# Altium schematic sheet Zasilanie.SchDoc (part 3 of 3)
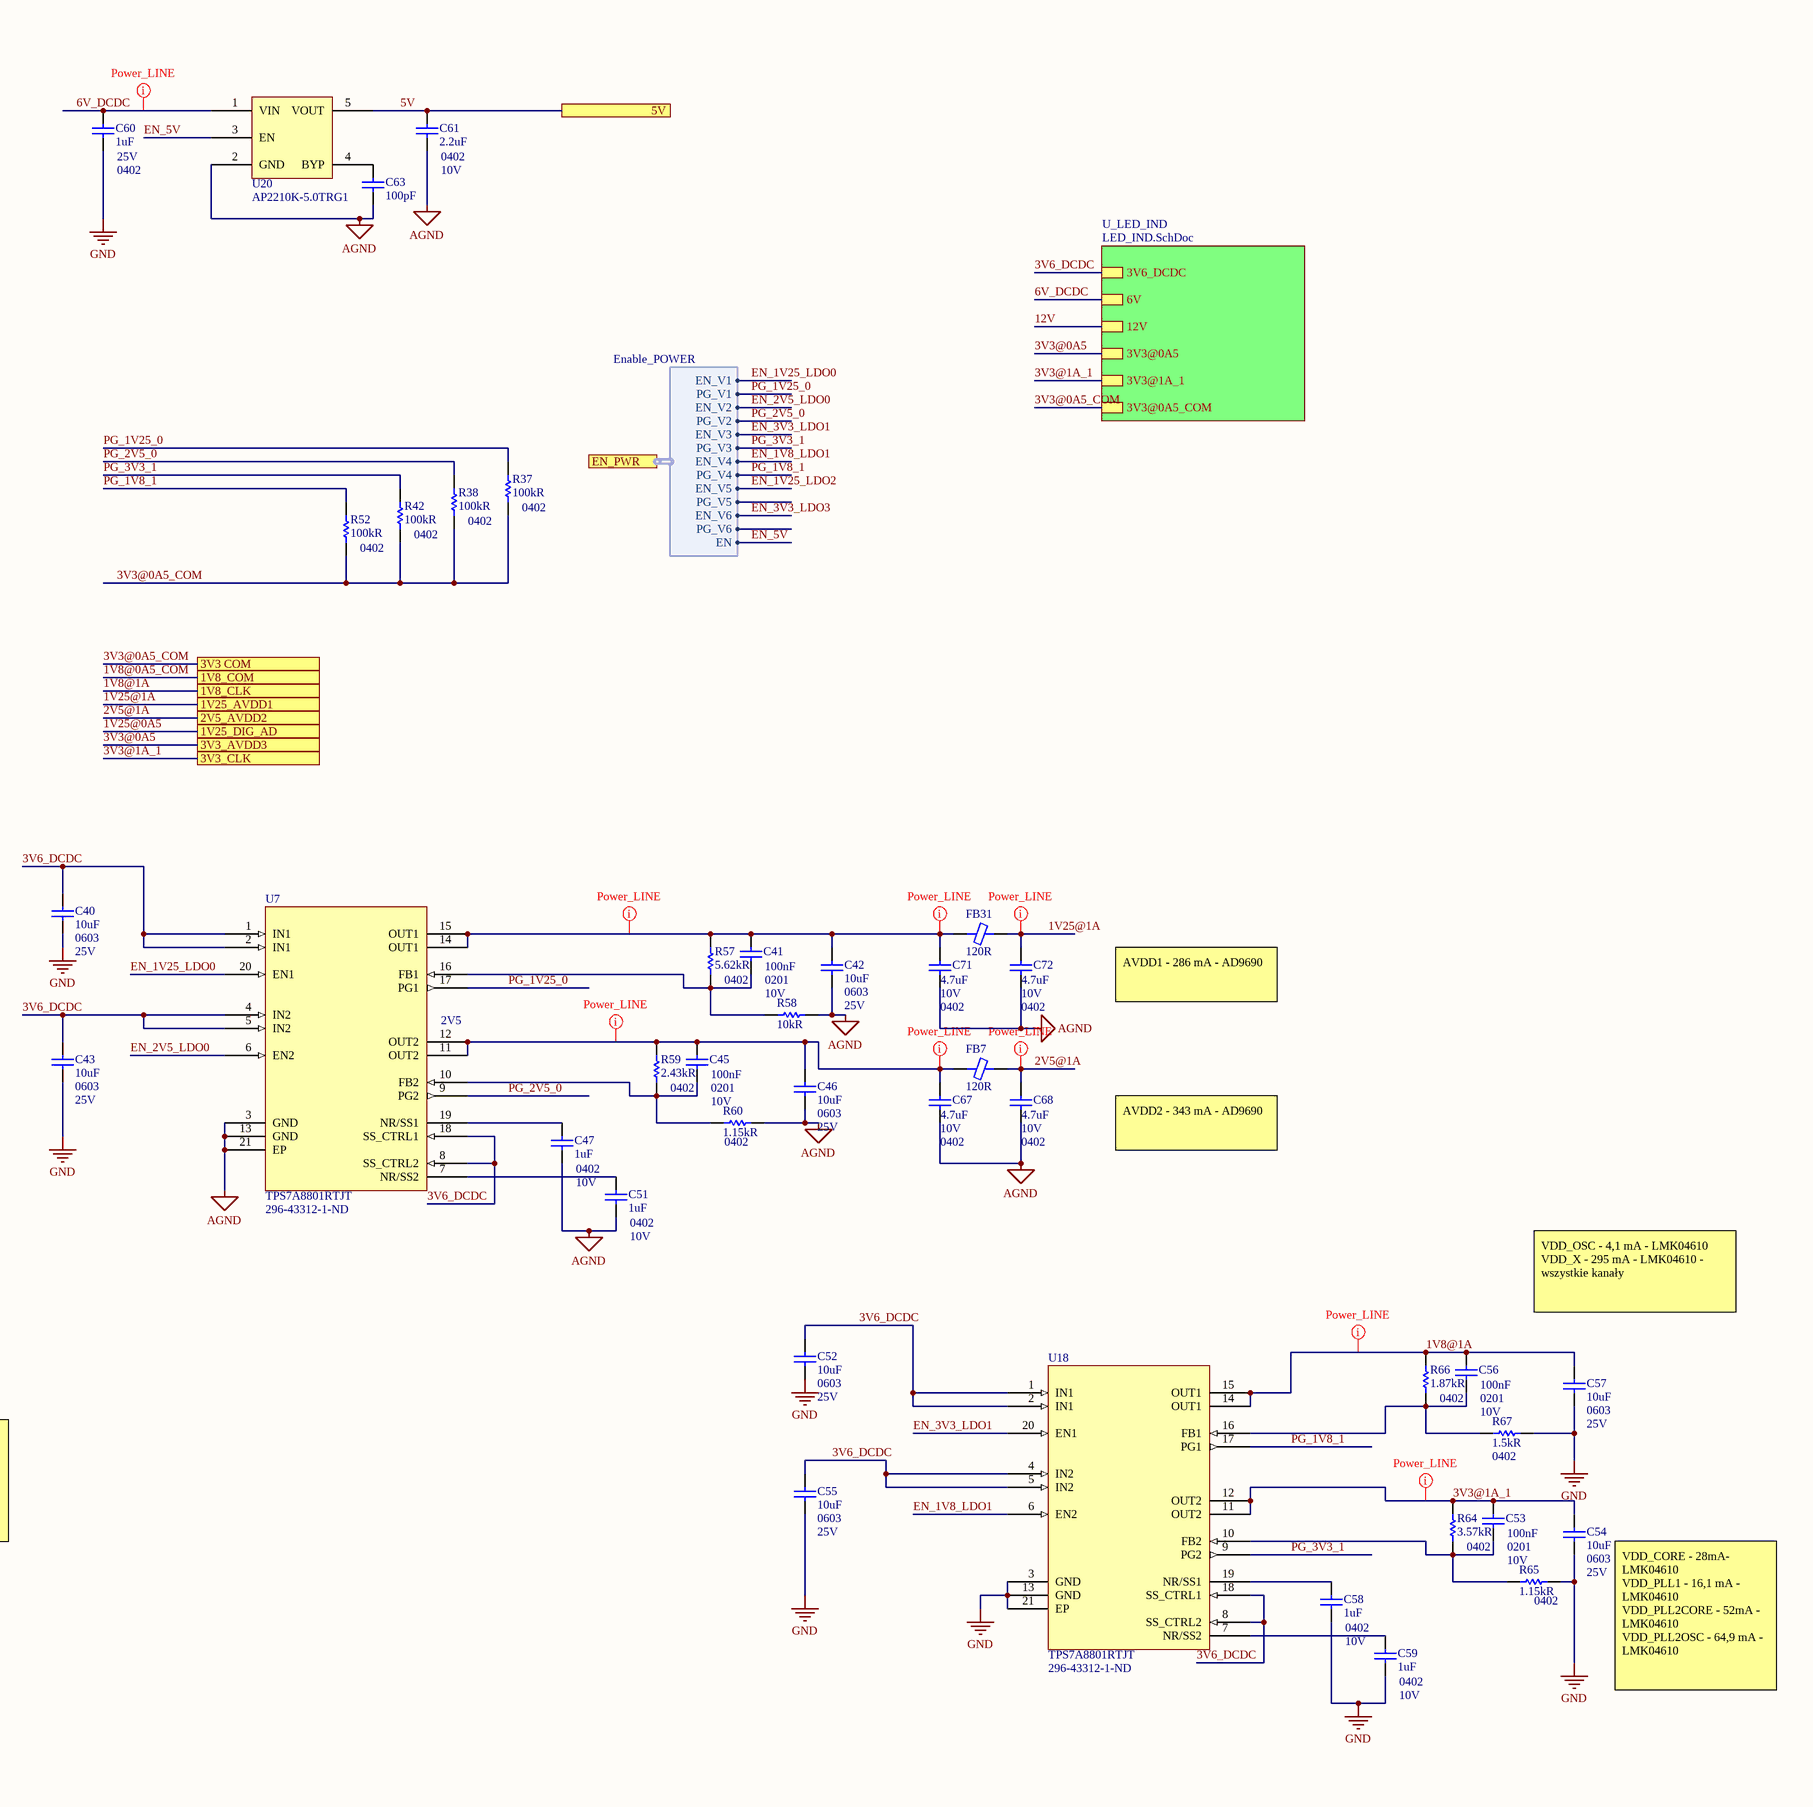
[diagram p3: Zasilanie.SchDoc, right]

## Library data of the parts (continued)
R68 R127 = Resistor: Res Thick Film 0402 14.7K Ohm 1% 0.063W(1/16W) ±100ppm/C Epoxy SMD T/R; Manufacturer: Yageo; Manufacturer Part Number: RC0402FR-0714K7L; Power Rating: 62.5mW; Voltage Rating: 50V; Temperature Coefficient: 100ppm/°C; Max Power Dissipation: 63mW; Supplier 1: Digi-Key; Supplier Part Number 1: YAG2984CT-ND; RoHS: Yes; Category: Chip SMD Resistors; Stock 1: 135925; Pricing 1: 1=0,10000, 10=0,01600, 100=0,00640, 1000=0,00289, 2500=0,00251, 5000=0,00207 (USD); Case Code (Imperial): 0402; Case Code (Metric): 1005; Contact Plating: Tin,Matte; Min Operating Temperature: -55°C; Max Operating Temperature: 155°C; Tolerance: 1%; Resistance: 14.7kR; Packaging: Tape and Reel; Composition: Thick Film; Number of Terminations: 2; Termination: SMD/SMT; Military Standard: Not; Features: Moisture Resistant; Length: 1mm; Height: 0.016inch; Width: 0.02inch; Depth: 0.5mm; Radiation Hardening: No; Lead Free: Lead Free; ComponentLink1URL: https://datasheet.ciiva.com/12668/pyu-rc0402-51-rohs-l-6-r-12668214.pdf?src-supplier=Mouser; ComponentLink1Description: https://datasheet.ciiva.com/12668/pyu-rc0402-51-rohs-l-6-r-12668214.pdf?src-supplier=Mouser; ComponentLink2URL: https://datasheet.ciiva.com/28404/pyu-rc0402-51-rohs-l-6-28404249.pdf?src-supplier=Avnet+Europe; ComponentLink2Description: https://datasheet.ciiva.com/28404/pyu-rc0402-51-rohs-l-6-28404249.pdf?src-supplier=Avnet+Europe; ComponentLink3URL: https://datasheet.ciiva.com/8890/pyu-rc0402-51-rohs-l-6-8890796.pdf?src-supplier=Avnet; ComponentLink3Description: https://datasheet.ciiva.com/8890/pyu-rc0402-51-rohs-l-6-8890796.pdf?src-supplier=Avnet; ComponentLink4URL: https://datasheet.ciiva.com/16869/pyu-rc0402-51-rohs-l-6-16869068.pdf?src-supplier=Avnet+Europe; ComponentLink4Description: https://datasheet.ciiva.com/16869/pyu-rc0402-51-rohs-l-6-16869068.pdf?src-supplier=Avnet+Europe; ComponentLink5URL: https://datasheet.ciiva.com/26829/getdatasheetpartid-326415-26829900.pdf?src-supplier=Verical; ComponentLink5Description: https://datasheet.ciiva.com/26829/getdatasheetpartid-326415-26829900.pdf?src-supplier=Verical
R118 = Resistor: RES SMD 51.1KOHM 0.1% 1/16W 0402; Manufacturer: Yageo; Manufacturer Part Number: RT0402BRD0751K1L; Voltage Rating: 50V; Power Rating: 62.5mW; Temperature Coefficient: 25ppm/°C; Max Power Dissipation: 63mW; Supplier 1: Digi-Key; Supplier Part Number 1: 13-RT0402BRD0751K1LCT-ND; RoHS: Yes; Category: Chip SMD Resistors; Stock 1: 9318; Pricing 1: 1=0,38000, 10=0,32000, 100=0,12500, 1000=0,05234, 2500=0,04798, 5000=0,04362 (USD); Case Code (Metric): 1005; Case Code (Imperial): 0402; Min Operating Temperature: -55°C; Max Operating Temperature: 125°C; Resistance: 51.1kR; Tolerance: 0.1%; Packaging: Tape and Reel; Package Quantity: 10000; Resistor Type: Thin Film; Termination: SMD/SMT; Number of Terminations: 2; Voltage Rating (DC): 50V; Length: 0.039inch; Width: 0.02inch; Height: 0.014inch; Lead Free: Lead Free; ComponentLink1URL: https://datasheet.ciiva.com/12724/pyu-rt-1-to-0-05-rohs-l-4-12724108.pdf?src-supplier=Mouser; ComponentLink1Description: https://datasheet.ciiva.com/12724/pyu-rt-1-to-0-05-rohs-l-4-12724108.pdf?src-supplier=Mouser; ComponentLink2URL: https://datasheet.ciiva.com/2582/pyu-rt-1-to-0-05-rohs-l-5-2582414.pdf?src-supplier=Digi-Key; ComponentLink2Description: https://datasheet.ciiva.com/2582/pyu-rt-1-to-0-05-rohs-l-5-2582414.pdf?src-supplier=Digi-Key
R121 R125 = Resistor: RES SMD 14.7KOHM 0.1% 1/16W 0402; Manufacturer: Yageo; Manufacturer Part Number: RT0402BRD0714K7L; Power Rating: 62.5mW; Voltage Rating: 50V; Temperature Coefficient: 25ppm/°C; Supplier 1: Digi-Key; Supplier Part Number 1: YAG4174CT-ND; RoHS: Yes; Category: Chip SMD Resistors; Stock 1: 23357; Pricing 1: 1=0,38000, 10=0,32000, 100=0,12500, 1000=0,05234, 2500=0,04798, 5000=0,04362 (USD); Case Code (Imperial): 0402; Case Code (Metric): 1005; Weight: 2.3E-05oz; Min Operating Temperature: -55°C; Max Operating Temperature: 125°C; Resistance: 14.7kR; Packaging: Tape and Reel; Tolerance: 0.1%; Resistor Type: Thin Film; Termination: SMD/SMT; Voltage Rating (DC): 50V; Length: 1mm; Width: 0.5mm; Height: 0.3mm; Depth: 0.5mm; Military Standard: Not; Lead Free: Lead Free; ComponentLink1URL: http://www.mouser.com/ds/2/447/yageodocoutput-1125656.pdf?src-supplier=Mouser; ComponentLink1Description: http://www.mouser.com/ds/2/447/yageodocoutput-1125656.pdf?src-supplier=Mouser; ComponentLink2URL: http://components.arrow.com/part/dataview/0323_03313223?src-supplier=Arrow+Europe; ComponentLink2Description: http://components.arrow.com/part/dataview/0323_03313223?src-supplier=Arrow+Europe; ComponentLink3URL: http://www.yageo.com/documents/recent/PYu-RT_1-to-0.01_RoHS_L_9.pdf?src-supplier=Digi-Key; ComponentLink3Description: http://www.yageo.com/documents/recent/PYu-RT_1-to-0.01_RoHS_L_9.pdf?src-supplier=Digi-Key
R122 = Resistor: RES SMD 95.3K OHM 0.1% 1/16W; Manufacturer: Yageo; Manufacturer Part Number: RT0402BRD0795K3L; Power Rating: 62.5mW; Voltage Rating: 50V; Max Power Dissipation: 63mW; Temperature Coefficient: 25ppm/°C; Supplier 1: Digi-Key; Supplier Part Number 1: YAG4322CT-ND; RoHS: Yes; Category: Chip SMD Resistors; Stock 1: 1587; Pricing 1: 1=0,38000, 10=0,32000, 100=0,12500, 1000=0,05234, 2500=0,04798, 5000=0,04362 (USD); Case Code (Metric): 1005; Case Code (Imperial): 0402; Min Operating Temperature: -55°C; Max Operating Temperature: 125°C; Package Quantity: 10000; Packaging: Tape and Reel; Resistance: 95.3kR; Tolerance: 0.1%; Resistor Type: Thin Film; Number of Terminations: 2; Termination: SMD/SMT; Voltage Rating (DC): 50V; Length: 0.039inch; Width: 0.02inch; Height: 0.014inch; Lead Free: Lead Free; ComponentLink1URL: https://datasheet.ciiva.com/2582/pyu-rt-1-to-0-05-rohs-l-5-2582534.pdf?src-supplier=Digi-Key; ComponentLink1Description: https://datasheet.ciiva.com/2582/pyu-rt-1-to-0-05-rohs-l-5-2582534.pdf?src-supplier=Digi-Key; ComponentLink2URL: https://datasheet.ciiva.com/12724/pyu-rt-1-to-0-05-rohs-l-4-12724119.pdf?src-supplier=Mouser; ComponentLink2Description: https://datasheet.ciiva.com/12724/pyu-rt-1-to-0-05-rohs-l-4-12724119.pdf?src-supplier=Mouser
R128 = Resistor: RES SMD 127K OHM 1% 1/16W 0402; Manufacturer: Yageo; Manufacturer Part Number: RC0402FR-07127KL; Power Rating: 62.5mW; Voltage Rating: 50V; Temperature Coefficient: 100ppm/°C; Max Power Dissipation: 63mW; Supplier 1: Digi-Key; Supplier Part Number 1: 311-127KLRCT-ND; RoHS: Yes; Category: Chip SMD Resistors; Stock 1: 164865; Pricing 1: 1=0,10000, 10=0,01400, 100=0,00580, 1000=0,00260, 2500=0,00226, 5000=0,00186 (USD); Case Code (Imperial): 0402; Case Code (Metric): 1005; Contact Plating: Tin,Matte; Min Operating Temperature: -55°C; Max Operating Temperature: 155°C; Resistance: 127kR; Tolerance: 1%; Packaging: Tape and Reel; Termination: SMD/SMT; Resistor Type: Thick Film; Number of Terminations: 2; Voltage Rating (DC): 50V; Package Quantity: 1; Features: Moisture Resistant; Length: 1mm; Width: 0.5mm; Height: 0.016inch; Depth: 0.5mm; Military Standard: Not; Lead Free: Lead Free; ComponentLink1URL: https://datasheet.ciiva.com/2453/pyu-r-int-thick-7-2453595.pdf?src-supplier=Digi-Key; ComponentLink1Description: https://datasheet.ciiva.com/2453/pyu-r-int-thick-7-2453595.pdf?src-supplier=Digi-Key; ComponentLink2URL: https://datasheet.ciiva.com/2453/pyu-r-int-thick-7-2453596.pdf?src-supplier=Digi-Key; ComponentLink2Description: https://datasheet.ciiva.com/2453/pyu-r-int-thick-7-2453596.pdf?src-supplier=Digi-Key; ComponentLink3URL: https://datasheet.ciiva.com/2453/pyu-r-int-thick-7-2453597.pdf?src-supplier=Digi-Key; ComponentLink3Description: https://datasheet.ciiva.com/2453/pyu-r-int-thick-7-2453597.pdf?src-supplier=Digi-Key; ComponentLink4URL: https://datasheet.ciiva.com/16869/pyu-rc0402-51-rohs-l-6-16869774.pdf?src-supplier=Avnet+Europe; ComponentLink4Description: https://datasheet.ciiva.com/16869/pyu-rc0402-51-rohs-l-6-16869774.pdf?src-supplier=Avnet+Europe
R131 = Resistor: Res Thick Film 0402 48.7K Ohm 1% 1/16W 100ppm/C Molded SMD Paper T/R; Manufacturer: Stackpole Electronics; Manufacturer Part Number: RMCF0402FT48K7; Max Power Dissipation: 63mW; Temperature Coefficient: 100ppm/°C; Supplier 1: Digi-Key; Supplier Part Number 1: RMCF0402FT48K7CT-ND; RoHS: Yes; Category: Chip SMD Resistors; Stock 1: 91344; Pricing 1: 1=0,10000, 10=0,01300, 100=0,00530, 1000=0,00239, 2500=0,00207, 5000=0,00171 (USD); Mount: Surface Mount; Case Code (Metric): 1005; Contact Plating: Tin,Matte; Case Code (Imperial): 0402; Min Operating Temperature: -55°C; Max Operating Temperature: 155°C; Features: Automotive AEC-Q200; Resistance: 48.7kR; Tolerance: 1%; Packaging: Tape and Reel; Resistor Type: Thick Film; Number of Terminations: 2; Length: 0.039inch; Width: 0.02inch; Height: 0.016inch; Lead Free: Lead Free; ComponentLink1URL: http://components.arrow.com/part/dataview/50597970S14177N1174?src-supplier=Arrow+Electronics; ComponentLink1Description: http://components.arrow.com/part/dataview/50597970S14177N1174?src-supplier=Arrow+Electronics; ComponentLink2URL: https://www.seielect.com/Catalog/SEI-RMCF_RMCP.pdf?src-supplier=Digi-Key; ComponentLink2Description: https://www.seielect.com/Catalog/SEI-RMCF_RMCP.pdf?src-supplier=Digi-Key; ComponentLink3URL: https://www.seielect.com/Catalog/SEI-RMCF_RMCP.pdf?src-supplier=Avnet; ComponentLink3Description: https://www.seielect.com/Catalog/SEI-RMCF_RMCP.pdf?src-supplier=Avnet; ComponentLink4URL: https://www.seielect.com/catalog/SEI-Packaging.pdf?src-supplier=Digi-Key; ComponentLink4Description: https://www.seielect.com/catalog/SEI-Packaging.pdf?src-supplier=Digi-Key
U7 U18 = TPS7A8801RTJT: IC REG LINEAR POS ADJ 1A 20QFN; Manufacturer: Texas Instruments; Output Voltage: 5V; Number of Regulators: 2; Min Current Limit: 1.5A; Quiescent Current: 2mA; Dropout Voltage: 130mV; Supplier 1: Digi-Key; Manufacturer Part Number: TPS7A8801RTJT; RoHS: Yes; Category: Voltage References; Stock 1: 1455; Pricing 1: 1=2,77000, 10=2,48700, 25=2,34600, 100=1,87670 (USD); Mount: Surface Mount; Case/Package: QFN; Number of Pins: 20; Min Operating Temperature: -40°C; Max Operating Temperature: 125°C; Packaging: Tape and Reel; Output Current: 1A; Number of Outputs: 2; Lead Free: Lead Free; ComponentLink1URL: http://www.ti.com/lit/gpn/tps7a88?src-supplier=Mouser; ComponentLink1Description: http://www.ti.com/lit/gpn/tps7a88?src-supplier=Mouser; ComponentLink2URL: http://www.ti.com/lit/ds/symlink/tps7a88.pdf?src-supplier=Digi-Key; ComponentLink2Description: http://www.ti.com/lit/ds/symlink/tps7a88.pdf?src-supplier=Digi-Key; ComponentLink3URL: http://www.ti.com/general/docs/lit/getliterature.tsp?genericPartNumber=TPS7A88&amp;&amp;fileType=pdf&src-supplier=Farnell; ComponentLink3Description: http://www.ti.com/general/docs/lit/getliterature.tsp?genericPartNumber=TPS7A88&amp;&amp;fileType=pdf&src-supplier=Farnell
U17 U22 = TPS62130RGTR: IC REG BUCK ADJ 3A SYNC 16QFN; Manufacturer: Texas Instruments; Output Voltage: 6V; Operating Supply Voltage: 17V; Number of Outputs: 1; Min Input Voltage: 3V; Switching Frequency: 2.5MHz; Synchronous Rectifier: Yes; Min Output Voltage: 900mV; Quiescent Current: 17uA; Output Type: Adjustable; Output Configuration: Positive; Supplier 1: Digi-Key; Manufacturer Part Number: TPS62130RGTR; RoHS: Yes; Category: Voltage Regulators - Switching; Stock 1: 11646; Pricing 1: 1=2,07000, 10=1,85500, 25=1,75000, 100=1,40000, 250=1,22500, 500=1,19000, 1000=0,94500 (USD); Case/Package: QFN; Number of Pins: 16; Contact Plating: Gold; Min Operating Temperature: -40°C; Max Operating Temperature: 125°C; Package Quantity: 3000; Output Current: 3A; Packaging: Tape and Reel; Max Output Current: 3A; Max Input Voltage: 17V; Max Output Voltage: 6V; REACH SVHC: No SVHC; Lead Free: Lead Free; ComponentLink1URL: https://datasheet.ciiva.com/4880/slvsag7-121391-4880626.pdf?src-supplier=Mouser; ComponentLink1Description: https://datasheet.ciiva.com/4880/slvsag7-121391-4880626.pdf?src-supplier=Mouser; ComponentLink2URL: https://datasheet.ciiva.com/14377/tps62130-14377867.pdf?src-supplier=Avnet; ComponentLink2Description: https://datasheet.ciiva.com/14377/tps62130-14377867.pdf?src-supplier=Avnet; ComponentLink3URL: https://datasheet.ciiva.com/41799/tps62130-41799070.pdf?src-supplier=Digi-Key; ComponentLink3Description: https://datasheet.ciiva.com/41799/tps62130-41799070.pdf?src-supplier=Digi-Key; Supplier Part Number 1: 296-37682-1-ND
U19 U21 U23 U24 = ADP125ACPZ-R7: IC REG LIN POS ADJ 500MA 8LFCSP; Manufacturer: Analog Devices; Output Voltage: 5V; Number of Outputs: 1; Dropout Voltage: 130mV; Max Input Voltage: 5.5V; Min Input Voltage: 2.3V; Min Current Limit: 550mA; Polarity: Positive; Quiescent Current: 45uA; Reference Voltage: 500mV; Min Output Voltage: 800mV; Accuracy: 1%; Power Supply Rejection Ratio (PSRR): 60dB; Max Supply Current: 210uA; Output Type: Adjustable; Supplier 1: Farnell; Manufacturer Part Number: ADP125ACPZ-R7; Stock 1: 261; RoHS: Yes; Case/Package: MSOP; Number of Pins: 8; Contact Plating: Gold; Min Operating Temperature: -40°C; Max Operating Temperature: 125°C; Output Current: 500mA; Max Output Current: 500mA; Packaging: Tape and Reel; Number of Regulators: 1; Max Output Voltage: 5V; Nominal Supply Current: 45uA; Operating Supply Current: 45uA; Length: 2mm; Height: 0.6mm; Width: 2mm; REACH SVHC: No SVHC; Lead Free: Contains Lead; ComponentLink1URL: https://datasheet.ciiva.com/17365/adp124-125-17365589.pdf?src-supplier=Avnet+Europe; ComponentLink1Description: https://datasheet.ciiva.com/17365/adp124-125-17365589.pdf?src-supplier=Avnet+Europe; ComponentLink2URL: https://datasheet.ciiva.com/2056/adp124-125-2056955.pdf?src-supplier=Digi-Key; ComponentLink2Description: https://datasheet.ciiva.com/2056/adp124-125-2056955.pdf?src-supplier=Digi-Key; ComponentLink3URL: https://datasheet.ciiva.com/2056/adp124-125-2056954.pdf?src-supplier=Digi-Key; ComponentLink3Description: https://datasheet.ciiva.com/2056/adp124-125-2056954.pdf?src-supplier=Digi-Key; ComponentLink4URL: https://datasheet.ciiva.com/2056/adp124-125-2056956.pdf?src-supplier=Digi-Key; ComponentLink4Description: https://datasheet.ciiva.com/2056/adp124-125-2056956.pdf?src-supplier=Digi-Key; ComponentLink5URL: https://datasheet.ciiva.com/48694/001251247-da-01-en-ic-reg-l-adj-adp125acpz-r7-lfcspud-8-adi-48694599.pdf?src-supplier=Conrad; ComponentLink5Description: https://datasheet.ciiva.com/48694/001251247-da-01-en-ic-reg-l-adj-adp125acpz-r7-lfcspud-8-adi-48694599.pdf?src-supplier=Conrad; Supplier 2: Digi-Key; Manufacturer 2: Analog Devices; Manufacturer Part Number 2: ADP125ACPZ-R7; Stock 2: 12322; Pricing 2: 1=1.39000, 10=1.23900, 25=1.17600, 100=0.96600, 250=0.90300, 500=0.79800, 1000=0.63000 (USD); ComponentLink6URL: http://datasheet.octopart.com/ADP125ACPZ-R7-Analog-Devices-datasheet-11525030.pdf?src-supplier=Newark; ComponentLink6Description: http://datasheet.octopart.com/ADP125ACPZ-R7-Analog-Devices-datasheet-11525030.pdf?src-supplier=Newark; ComponentLink7URL: http://datasheet.octopart.com/ADP125ACPZ-R7-Analog-Devices-datasheet-38878834.pdf?src-supplier=Newark; ComponentLink7Description: http://datasheet.octopart.com/ADP125ACPZ-R7-Analog-Devices-datasheet-38878834.pdf?src-supplier=Newark; ComponentLink8URL: http://datasheet.octopart.com/ADP125ACPZ-R7-Analog-Devices-datasheet-10623001.pdf?src-supplier=Analog+Devices; ComponentLink8Description: http://datasheet.octopart.com/ADP125ACPZ-R7-Analog-Devices-datasheet-10623001.pdf?src-supplier=Analog+Devices; ComponentLink9URL: http://datasheet.octopart.com/ADP125ACPZ-R7-Analog-Devices-datasheet-8638579.pdf?src-supplier=Analog+Devices; ComponentLink9Description: http://datasheet.octopart.com/ADP125ACPZ-R7-Analog-Devices-datasheet-8638579.pdf?src-supplier=Analog+Devices; ComponentLink10URL: http://datasheet.octopart.com/ADP125ACPZ-R7-Analog-Devices-datasheet-11776558.pdf?src-supplier=Arrow; ComponentLink10Description: http://datasheet.octopart.com/ADP125ACPZ-R7-Analog-Devices-datasheet-11776558.pdf?src-supplier=Arrow; Supplier Part Number 2: ADP125ACPZ-R7CT-ND; Supplier Part Number 1: 2457144
U20 = AP2210K-5.0TRG1: IC REG LINEAR 5V 300MA SOT23-5; Manufacturer: Diodes; Output Type: Fixed; Power Supply Rejection Ratio (PSRR): 75dB; Number of Outputs: 1; Min Input Voltage: 2.5V; Max Input Voltage: 13.2V; Dropout Voltage: 250mV; Polarity: Positive; Quiescent Current: 150uA; Accuracy: 1%; Supplier 1: Digi-Key; Manufacturer Part Number: AP2210K-5.0TRG1; RoHS: Yes; Category: Voltage Regulators - Linear; Stock 1: 36767; Pricing 1: 1=0,42000, 10=0,34200, 25=0,31280, 100=0,21090, 250=0,17452, 500=0,15998, 1000=0,11999 (USD); Mount: Surface Mount; Case/Package: SOT-23-5; Number of Pins: 5; Weight: 0.001058oz; Min Operating Temperature: -40°C; Max Operating Temperature: 125°C; Max Output Current: 300mA; Output Voltage: 5V; Package Quantity: 3000; Packaging: Tape and Reel; Output Current: 300mA; Number of Regulators: 1; Lead Free: Lead Free; ComponentLink1URL: https://datasheet.ciiva.com/29569/ap2210-29569974.pdf?src-supplier=Digi-Key; ComponentLink1Description: https://datasheet.ciiva.com/29569/ap2210-29569974.pdf?src-supplier=Digi-Key; ComponentLink2URL: https://datasheet.ciiva.com/29569/ap2210-29569975.pdf?src-supplier=Digi-Key; ComponentLink2Description: https://datasheet.ciiva.com/29569/ap2210-29569975.pdf?src-supplier=Digi-Key; ComponentLink3URL: https://datasheet.ciiva.com/29569/ap2210-29569976.pdf?src-supplier=Digi-Key; ComponentLink3Description: https://datasheet.ciiva.com/29569/ap2210-29569976.pdf?src-supplier=Digi-Key; Supplier Part Number 1: AP2210K-5.0TRG1DICT-ND